# Altium schematic sheet AdvancedDiscreteOpAmp.SchDoc
size A4; SheetNumber: 3; SheetTotal: 4
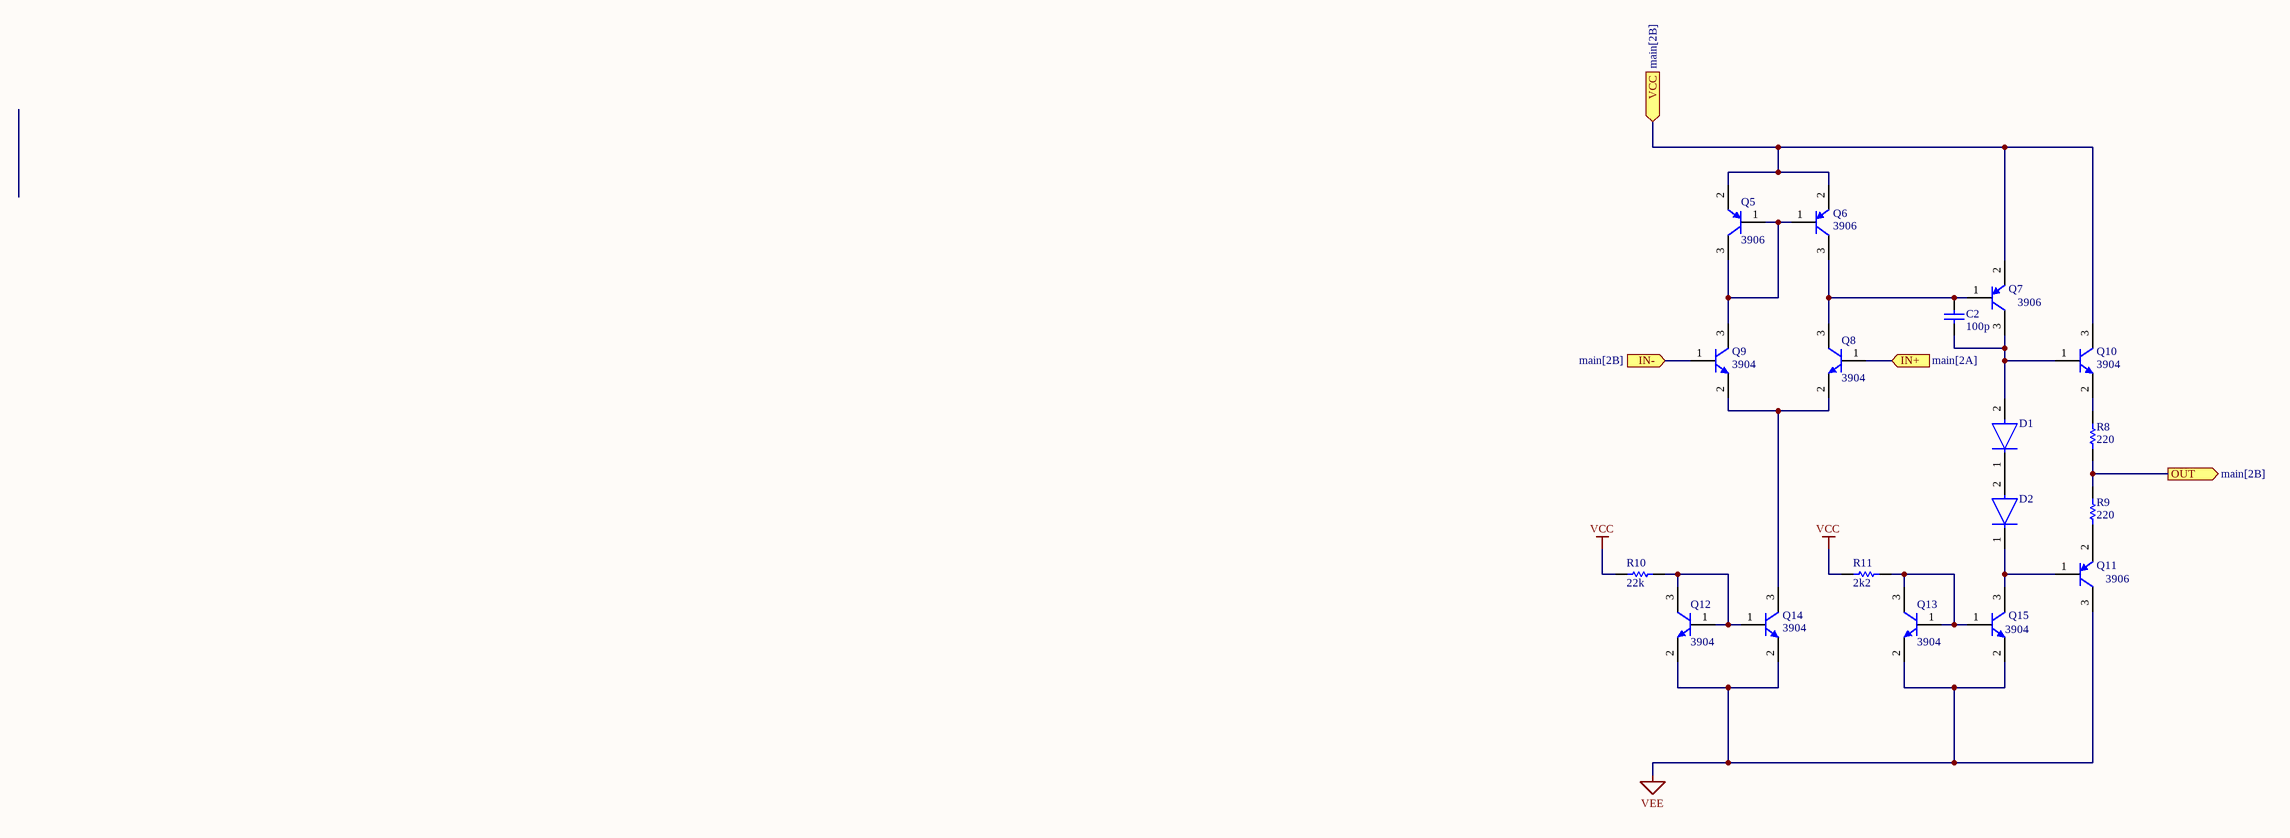
[diagram p0: AdvancedDiscreteOpAmp.SchDoc]

## Parts
C2  100p  [CAPC2013X145X48ML20T23]
D1  (no value)  [FP-96547-MFG]
D2  (no value)  [FP-96547-MFG]
Q5  3906  [ONSC-SOT-23-3-318-08_V]
Q6  3906  [ONSC-SOT-23-3-318-08_V]
Q7  3906  [ONSC-SOT-23-3-318-08_V]
Q8  3904  [ONSC-SOT-23-3-318-08_V]
Q9  3904  [ONSC-SOT-23-3-318-08_V]
Q10  3904  [ONSC-SOT-23-3-318-08_V]
Q11  3906  [ONSC-SOT-23-3-318-08_V]
Q12  3904  [ONSC-SOT-23-3-318-08_V]
Q13  3904  [ONSC-SOT-23-3-318-08_V]
Q14  3904  [ONSC-SOT-23-3-318-08_V]
Q15  3904  [ONSC-SOT-23-3-318-08_V]
R8  220  [RESC2013X50X30ML20T20]
R9  220  [RESC2013X50X30ML20T20]
R10  22k  [RESC2013X50X30ML20T20]
R11  2k2  [RESC2013X50X30ML20T20]

## Ports
IN+ (in, see main[2A]), IN- (in, see main[2B]), OUT (out, see main[2B]), VCC (in, see main[2B])

## Nets
VCC: R10.2 R11.2
VEE: Q11.3(C) Q12.2(E) Q13.2(E) Q14.2(E) Q15.2(E)
IN+: Q8.1(B) ; port IN+
IN-: Q9.1(B) ; port IN-
OUT: R8.1 R9.2 ; port OUT
VCC: Q5.2(E) Q6.2(E) Q7.2(E) Q10.3(C) ; port VCC  [a separate net that carries the same name]
NetC2_1: C2.1 D1.2(A) Q7.3(C) Q10.1(B)
NetC2_2: C2.2 Q6.3(C) Q7.1(B) Q8.3(C)
NetD1_1: D1.1(C) D2.2(A)
NetD2_1: D2.1(C) Q11.1(B) Q15.3(C)
NetQ5_1: Q5.1(B) Q5.3(C) Q6.1(B) Q9.3(C)
NetQ8_2: Q8.2(E) Q9.2(E) Q14.3(C)
NetQ10_2: Q10.2(E) R8.2
NetQ11_2: Q11.2(E) R9.1
NetQ12_1: Q12.1(B) Q12.3(C) Q14.1(B) R10.1
NetQ13_1: Q13.1(B) Q13.3(C) Q15.1(B) R11.1

## Library data of the parts
C2 = CMP-2007-01701-1: Manufacturer: Vitramon; Part Number: VJ0805A101KXAAC
D1 D2 = CMP-02540-000039-1: DIODE AVALANCHE 1KV 1.5A DO220; Manufacturer Part Number: AS1PM-M3/84A; Manufacturer: Vishay; Automotive Grade: Grade 0; Peak Reverse Current: 0.3uA; Value: 10.4pF; Max Junction Temp: +175°C; Max Repetitive Reverse Voltage: 1000V; Max Surge Forward Current: 30A; Package: 96547; Forward Current: 1.5A; Automotive: Yes; Octopart: https://octopart.com/as1pm-m3%2F84a-vishay-44629776; Mouser Description: AS1PM-M3/84A; SMT Avalanche Diode; 1000V 1.5A; 1.5us; 2-Pin DO-220AA; Temperature Range High: +175°C; RoHS: TRUE; Lead Free: Yes; Temperature Range Low: -55°C; Device Class L3: Rectifier Diodes; Temperature: -55°C to +175°C; ComponentLink2URL: https://www.vishay.com/docs/89290/as1pm.pdf; Device Class L2: Diodes; Footprint Url: https://www.vishay.com/docs/96547/smp_do-220aa.pdf; Device Class L1: Discrete Semiconductors; Digikey Description: DIODE AVALANCHE 1KV 1.5A DO220; Capacitance: 10.4pF; Height: 1.15mm; ComponentLink2Description: Datasheet; Category: Diode
Q5-Q7 Q11 = CMP-1048-00670-1: General Purpose Transistor, PNP Silicon, 3-Pin SOT-23, Pb-Free, Tape and Reel; PartNumber: MMBT3906LT1G; Manufacturer: On Semiconductor; IC Continuous (A): -0.2; fT Min (MHz): 250; PackageDescription: 3-Pin Small Outline Transistor, Body 2.92 x 1.3 mm, Pitch 0.95 mm; Packing: Tape and Reel; ComponentLink3Description: Package Specification; Mounting Technology: Surface Mount; ComponentLink3URL: http://www.onsemi.cn/pub_link/Collateral/318-08.PDF; ComponentLink1URL: http://www.onsemi.com/; ComponentLink2URL: http://www.onsemi.cn/pub_link/Collateral/MMBT3906LT1-D.PDF; PackageReference: SOT-23-3-318-08; Polarity: PNP; ComponentLink2Description: Datasheet; PackageVersion: Rev. AP, 11/2009; RoHS: TRUE; DatasheetVersion: Rev. 11; ComponentLink1Description: Manufacturer URL
Q8-Q10 Q12-Q15 = CMP-1048-00630-1: General Purpose Transistor, NPN Silicon, 3-Pin SOT-23, Pb-Free, Tape and Reel; Manufacturer: On Semiconductor; PartNumber: MMBT3904LT3G; fT Min (MHz): 300; IC Continuous (A): 0.2; PackageVersion: Rev. AP, 11/2009; PackageReference: SOT-23-3-318-08; Packing: Tape and Reel; RoHS: TRUE; ComponentLink2Description: Datasheet; PackageDescription: 3-Pin Small Outline Transistor, Body 2.92 x 1.3 mm, Pitch 0.95 mm; ComponentLink1Description: Manufacturer URL; ComponentLink3URL: http://www.onsemi.cn/pub_link/Collateral/318-08.PDF; Mounting Technology: Surface Mount; ComponentLink3Description: Package Specification; DatasheetVersion: Rev. 12; ComponentLink1URL: http://www.onsemi.com/; ComponentLink2URL: http://www.onsemi.cn/pub_link/Collateral/MMBT3904LT1-D.PDF; Polarity: NPN
R8-R11 = CMP-2001-03596-1: Part Number: CRCW08051K00FKEB; Manufacturer: Vishay Dale